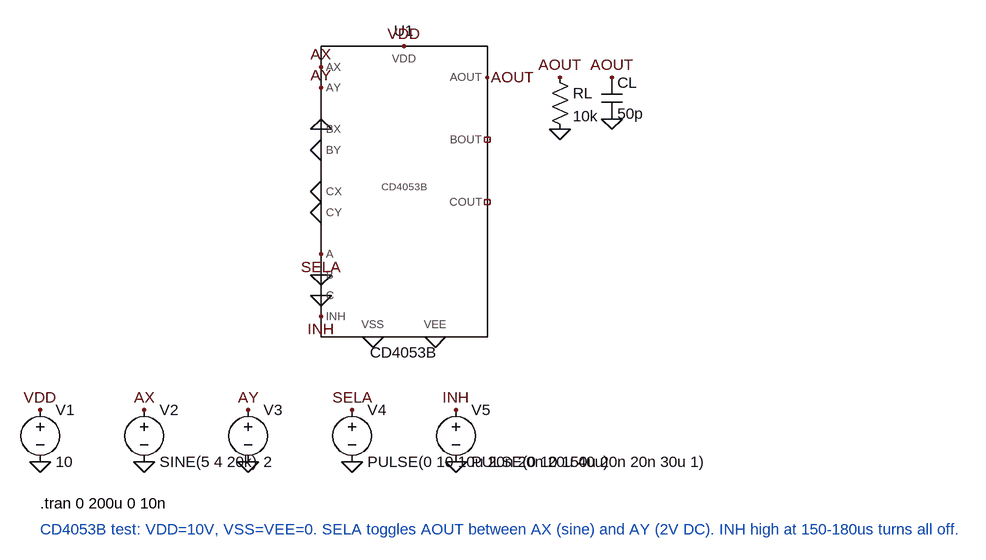
[diagram p0: schematic CD4053B_test.asc]
CD4053B_test.asc, the LTspice schematic file:
Version 4
SHEET 1 1280 900
SYMBOL CD4053B 640 320 R0
SYMATTR InstName U1
FLAG 512 128 AX
FLAG 512 160 AY
FLAG 512 224 0
FLAG 512 256 0
FLAG 512 320 0
FLAG 512 352 0
FLAG 512 416 SELA
FLAG 512 448 0
FLAG 512 480 0
FLAG 512 512 INH
FLAG 768 144 AOUT
FLAG 640 96 VDD
FLAG 592 544 0
FLAG 688 544 0
SYMBOL voltage 80 640 R0
SYMATTR InstName V1
SYMATTR Value 10
FLAG 80 656 VDD
FLAG 80 736 0
SYMBOL voltage 240 640 R0
SYMATTR InstName V2
SYMATTR Value SINE(5 4 20k)
FLAG 240 656 AX
FLAG 240 736 0
SYMBOL voltage 400 640 R0
SYMATTR InstName V3
SYMATTR Value 2
FLAG 400 656 AY
FLAG 400 736 0
SYMBOL voltage 560 640 R0
SYMATTR InstName V4
SYMATTR Value PULSE(0 10 10u 20n 20n 20u 40u)
FLAG 560 656 SELA
FLAG 560 736 0
SYMBOL voltage 720 640 R0
SYMATTR InstName V5
SYMATTR Value PULSE(0 10 150u 20n 20n 30u 1)
FLAG 720 656 INH
FLAG 720 736 0
SYMBOL res 864 128 R0
SYMATTR InstName RL
SYMATTR Value 10k
FLAG 880 144 AOUT
FLAG 880 224 0
SYMBOL cap 944 144 R0
SYMATTR InstName CL
SYMATTR Value 50p
FLAG 960 144 AOUT
FLAG 960 208 0
TEXT 80 800 Left 2 !.tran 0 200u 0 10n
TEXT 80 840 Left 2 ;CD4053B test: VDD=10V, VSS=VEE=0. SELA toggles AOUT between AX (sine) and AY (2V DC). INH high at 150-180us turns all off.

The netlist it stands for:
* CD4053B_test.asc
XU1 0 0 0 NC_01 0 INH 0 0 0 0 SELA AX AY AOUT NC_02 VDD CD4053B  ; pins BY BX CY COUT CX INH VEE VSS C B A AX AY AOUT BOUT VDD
V1 VDD 0 10
V2 AX 0 SINE(5 4 20k)
V3 AY 0 2
V4 SELA 0 PULSE(0 10 10u 20n 20n 20u 40u)
V5 INH 0 PULSE(0 10 150u 20n 20n 30u 1)
RL AOUT 0 10k
CL AOUT 0 50p
.tran 0 200u 0 10n
* CD4053B test: VDD=10V, VSS=VEE=0. SELA toggles AOUT between AX (sine) and AY (2V DC). INH high at 150-180us turns all off.
.lib CD4053B.lib
.backanno
.end